# Altium schematic sheet Controller_Section.SchDoc
size A4; DocumentNumber: 4; SheetNumber: 4; SheetTotal: 7
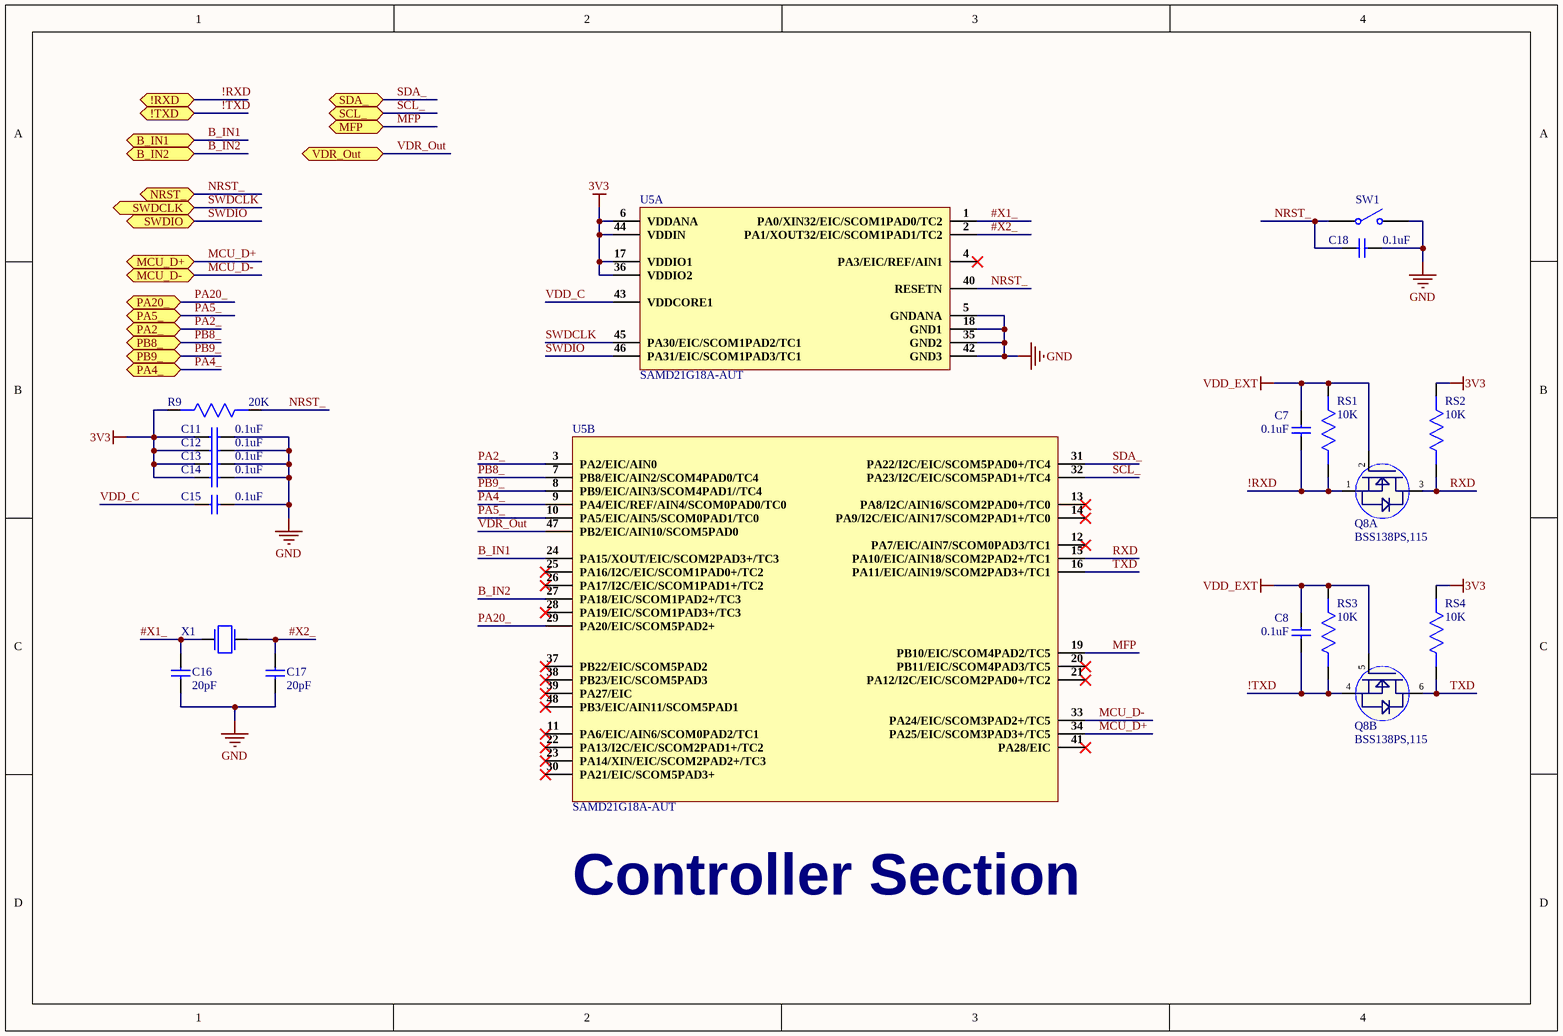
[diagram p0: Controller_Section.SchDoc]

## Parts
C7  0.1uF  [Cap0402]
C8  0.1uF  [Cap0402]
C11  0.1uF  [Cap0402]
C12  0.1uF  [Cap0402]
C13  0.1uF  [Cap0402]
C14  0.1uF  [Cap0402]
C15  0.1uF  [Cap0402]
C16  20pF  [Cap 0201]
C17  20pF  [Cap 0201]
C18  0.1uF  [Cap0402]
Q8  BSS138PS,115  [BSS138PS,115]  (parts A,B of 2)
R9  20K  [Res0402]
RS1  10K  [Res0402]
RS2  10K  [Res0402]
RS3  10K  [Res0402]
RS4  10K  [Res0402]
SW1  B3U-1000P  [B3U-1000P]  (value not drawn)
U5  SAMD21G18A-AUT  [SAMD21G18A-AUT]  (parts A,B of 2)
X1  NX3215SA-32.768K-STD-MUA-8  [2-SMD, No Lead]  (value not drawn)

## Ports
!RXD (bidir), !TXD (bidir), B_IN1 (bidir), B_IN2 (bidir), MCU_D+ (bidir), MCU_D- (bidir), MFP (bidir), NRST_ (bidir), PA2_ (bidir), PA4_ (bidir), PA5_ (bidir), PA20_ (bidir), PB8_ (bidir), PB9_ (bidir), SCL_ (bidir), SDA_ (bidir), SWDCLK (bidir), SWDIO (bidir), VDR_Out (bidir)

## Nets
3V3: C11.1 C12.1 C13.1 C14.1 R9.2 RS2.1 RS4.1 U5.6(VDDANA) U5.17(VDDIO1) U5.36(VDDIO2) U5.44(VDDIN)
GND: C11.2 C12.2 C13.2 C14.2 C15.2 C16.1 C17.1 C18.2 SW1.2 U5.5(GNDANA) U5.18(GND1) U5.35(GND2) U5.42(GND3)
VDD_EXT: C7.2 C8.2 Q8.2(G1) Q8.5(G2) RS1.1 RS3.1
!RXD: C7.1 Q8.1(S1) RS1.2 ; port !RXD
!TXD: C8.1 Q8.4(S2) RS3.2 ; port !TXD
#X1_: C16.2 U5.1(PA0/XIN32/EIC/SCOM1PAD0/TC2) X1.2
#X2_: C17.2 U5.2(PA1/XOUT32/EIC/SCOM1PAD1/TC2) X1.1
B_IN1: U5.24(PA15/XOUT/EIC/SCOM2PAD3+/TC3) ; port B_IN1
B_IN2: U5.27(PA18/EIC/SCOM1PAD2+/TC3) ; port B_IN2
MCU_D+: U5.34(PA25/EIC/SCOM3PAD3+/TC5) ; port MCU_D+
MCU_D-: U5.33(PA24/EIC/SCOM3PAD2+/TC5) ; port MCU_D-
MFP: U5.19(PB10/EIC/SCOM4PAD2/TC5) ; port MFP
NRST_: C18.1 R9.1 SW1.1 U5.40(RESETN) ; port NRST_
PA2_: U5.3(PA2/EIC/AIN0) ; port PA2_
PA4_: U5.9(PA4/EIC/REF/AIN4/SCOM0PAD0/TC0) ; port PA4_
PA5_: U5.10(PA5/EIC/AIN5/SCOM0PAD1/TC0) ; port PA5_
PA20_: U5.29(PA20/EIC/SCOM5PAD2+) ; port PA20_
PB8_: U5.7(PB8/EIC/AIN2/SCOM4PAD0/TC4) ; port PB8_
PB9_: U5.8(PB9/EIC/AIN3/SCOM4PAD1//TC4) ; port PB9_
RXD: Q8.3(D2) RS2.2 U5.15(PA10/EIC/AIN18/SCOM2PAD2+/TC1)
SCL_: U5.32(PA23/I2C/EIC/SCOM5PAD1+/TC4) ; port SCL_
SDA_: U5.31(PA22/I2C/EIC/SCOM5PAD0+/TC4) ; port SDA_
SWDCLK: U5.45(PA30/EIC/SCOM1PAD2/TC1) ; port SWDCLK
SWDIO: U5.46(PA31/EIC/SCOM1PAD3/TC1) ; port SWDIO
TXD: Q8.6(D1) RS4.2 U5.16(PA11/EIC/AIN19/SCOM2PAD3+/TC1)
VDD_C: C15.1 U5.43(VDDCORE1)
VDR_Out: U5.47(PB2/EIC/AIN10/SCOM5PAD0) ; port VDR_Out

Not connected (* = marked no-connect by the designer): U5 4(PA3/EIC/REF/AIN1)* 11(PA6/EIC/AIN6/SCOM0PAD2/TC1)* 12(PA7/EIC/AIN7/SCOM0PAD3/TC1)* 13(PA8/I2C/AIN16/SCOM2PAD0+/TC0)* 14(PA9/I2C/EIC/AIN17/SCOM2PAD1+/TC0)* 20(PB11/EIC/SCOM4PAD3/TC5)* 21(PA12/I2C/EIC/SCOM2PAD0+/TC2)* 22(PA13/I2C/EIC/SCOM2PAD1+/TC2)* 23(PA14/XIN/EIC/SCOM2PAD2+/TC3)* 25(PA16/I2C/EIC/SCOM1PAD0+/TC2)* 26(PA17/I2C/EIC/SCOM1PAD1+/TC2)* 28(PA19/EIC/SCOM1PAD3+/TC3)* 30(PA21/EIC/SCOM5PAD3+)* 37(PB22/EIC/SCOM5PAD2)* 38(PB23/EIC/SCOM5PAD3)* 39(PA27/EIC)* 41(PA28/EIC)* 48(PB3/EIC/AIN11/SCOM5PAD1)*

## Notes on the sheet
- Controller Section

## Library data of the parts
C7 C8 C11-C15 C18 = CC0402KRX7R7BB104: CAP CER 0.1UF 16V X7R 0402; Manufacturer: Yageo; Tolerance: 10%; Capacitance: 100nF; Supplier 1: Digi-Key; Manufacturer Part Number: CC0402KRX7R7BB104; Stock 1: 16982736; Pricing 1: 1=0.1, 10=0.034, 100=0.015, 500=0.0107, 1000=0.00841, 2500=0.00764, 5000=0.00703 (USD); Mount: Surface Mount; Case/Package: 0402; Number of Pins: 2; Case Code (Metric): 1005; Case Code (Imperial): 0402; Min Operating Temperature: -55°C; Max Operating Temperature: 125°C; Dielectric: X7R; Voltage Rating: 16V; Voltage Rating (DC): 16V; Packaging: Tape and Reel; Package Quantity: 1; Termination: SMD/SMT; Composition: Ceramic; Voltage: 16V; Length: 1mm; Height: 0.5mm; Width: 0.02inch; Thickness: 0.022inch; Depth: 0.5mm; Radiation Hardening: No; REACH SVHC: No SVHC; Lead Free: Lead Free; Halogen Free: Halogen Free; ComponentLink1URL: http://www.yageo.com/documents/recent/UPY-GPHC_X7R_6.3V-to-50V_8.pdf?src-supplier=Avnet+Europe; ComponentLink1Description: http://www.yageo.com/documents/recent/UPY-GPHC_X7R_6.3V-to-50V_8.pdf?src-supplier=Avnet+Europe; ComponentLink2URL: http://www.yageo.com/documents/recent/UPY-GPHC_X7R_6.3V-to-50V_18.pdf?src-supplier=Digi-Key; ComponentLink2Description: http://www.yageo.com/documents/recent/UPY-GPHC_X7R_6.3V-to-50V_18.pdf?src-supplier=Digi-Key; ComponentLink3URL: http://www.yageo.com/documents/recent/UPY-GPHC_X7R_6.3V-to-50V_8.pdf?src-supplier=Avnet; ComponentLink3Description: http://www.yageo.com/documents/recent/UPY-GPHC_X7R_6.3V-to-50V_8.pdf?src-supplier=Avnet; ComponentLink4URL: http://www.yageo.com/documents/recent/UPY-GPHC_X7R_6.3V-to-50V_18.pdf?src-supplier=Mouser; ComponentLink4Description: http://www.yageo.com/documents/recent/UPY-GPHC_X7R_6.3V-to-50V_18.pdf?src-supplier=Mouser; ComponentLink5URL: http://www.farnell.com/datasheets/2167236.pdf?src-supplier=Element14; ComponentLink5Description: http://www.farnell.com/datasheets/2167236.pdf?src-supplier=Element14; ComponentLink6URL: http://www.farnell.com/datasheets/1489800.pdf?src-supplier=Element14; ComponentLink6Description: http://www.farnell.com/datasheets/1489800.pdf?src-supplier=Element14; Supplier Part Number 1: 311-1338-1-ND
C16 C17 = GJM0336C1E200JB01D: CAP CER 20PF 25V C0H 0201; Manufacturer: Murata; Tolerance: 5%; Supplier 1: Digi-Key; Manufacturer Part Number: GJM0336C1E200JB01D; Stock 1: 13650; Pricing 1: 1=0.1, 10=0.074, 100=0.0329, 500=0.02348, 1000=0.01845, 2500=0.01678, 5000=0.01543 (USD); Mount: Surface Mount; Case/Package: 0201; Case Code (Metric): 0603; Case Code (Imperial): 0201; Min Operating Temperature: -55°C; Max Operating Temperature: 125°C; Capacitance: 20pF; Voltage Rating: 25V; Packaging: Tape and Reel; Termination: SMD/SMT; Voltage Rating (DC): 25V; Length: 0.024inch; Width: 0.012inch; Thickness: 0.013inch; Lead Free: Lead Free; ComponentLink1URL: http://www.mouser.com/ds/2/281/c02e-2905.pdf?src-supplier=Mouser; ComponentLink1Description: http://www.mouser.com/ds/2/281/c02e-2905.pdf?src-supplier=Mouser; ComponentLink2URL: http://search.murata.co.jp/Ceramy/image/img/A01X/partnumbering_e_01.pdf?src-supplier=Digi-Key; ComponentLink2Description: http://search.murata.co.jp/Ceramy/image/img/A01X/partnumbering_e_01.pdf?src-supplier=Digi-Key; Supplier Part Number 1: 490-13313-1-ND
Q8 = BSS138PS,115: MOSFET 2N-CH 60V 0.32A 6TSSOP; Manufacturer: Nexperia; Supplier 1: Digi-Key; Manufacturer Part Number: BSS138PS,115; Stock 1: 143402; Pricing 1: 1=0.42, 10=0.31, 25=0.2716, 100=0.1474, 250=0.14668, 500=0.12028, 1000=0.08924 (USD); ComponentLink1URL: http://www.farnell.com/datasheets/1443348.pdf?src-supplier=Farnell; ComponentLink1Description: http://www.farnell.com/datasheets/1443348.pdf?src-supplier=Farnell; ComponentLink2URL: https://assets.nexperia.com/documents/data-sheet/BSS138PS.pdf?src-supplier=Digi-Key; ComponentLink2Description: https://assets.nexperia.com/documents/data-sheet/BSS138PS.pdf?src-supplier=Digi-Key; ComponentLink3URL: http://www.farnell.com/datasheets/1443348.pdf?src-supplier=Newark; ComponentLink3Description: http://www.farnell.com/datasheets/1443348.pdf?src-supplier=Newark; Supplier Part Number 1: 1727-6479-1-ND
R9 = RC0402JR-0720KL: RES SMD 20K OHM 5% 1/16W 0402; Manufacturer: Yageo; Resistance: 20kR; Power Rating: 62.5mW; Voltage Rating: 50V; Temperature Coefficient: 100ppm/°C; Max Power Dissipation: 63mW; Supplier 1: Digi-Key; Manufacturer Part Number: RC0402JR-0720KL; Stock 1: 4817510; Pricing 1: 1=0.1, 10=0.013, 100=0.0053, 1000=0.00236, 2500=0.00205, 5000=0.00169 (USD); Case/Package: 0402; Number of Pins: 2; Case Code (Metric): 1005; Case Code (Imperial): 0402; Min Operating Temperature: -55°C; Max Operating Temperature: 155°C; Package Quantity: 1; Tolerance: 5%; Packaging: Tape and Reel; Composition: Thick Film; Number of Terminations: 2; Termination: SMD/SMT; Military Standard: Not; Voltage Rating (DC): 50V; Features: Moisture Resistant; Length: 0.039inch; Height: 0.016inch; Width: 0.02inch; Depth: 0.5mm; REACH SVHC: No SVHC; Lead Free: Lead Free; ComponentLink1URL: http://www.yageo.com/documents/recent/PYu-RC_Group_51_RoHS_L_9.pdf?src-supplier=Digi-Key; ComponentLink1Description: http://www.yageo.com/documents/recent/PYu-RC_Group_51_RoHS_L_9.pdf?src-supplier=Digi-Key; ComponentLink2URL: http://www.farnell.com/datasheets/1018594.pdf?src-supplier=Element14; ComponentLink2Description: http://www.farnell.com/datasheets/1018594.pdf?src-supplier=Element14; ComponentLink3URL: http://www.mouser.com/ds/2/447/PYu-RC0402_51_RoHS_L_6_r-8721.pdf?src-supplier=Mouser; ComponentLink3Description: http://www.mouser.com/ds/2/447/PYu-RC0402_51_RoHS_L_6_r-8721.pdf?src-supplier=Mouser; ComponentLink4URL: http://www.yageo.com/documents/recent/PYu-RC0402_51_RoHS_L_6_r.pdf?src-supplier=Future+Electronics; ComponentLink4Description: http://www.yageo.com/documents/recent/PYu-RC0402_51_RoHS_L_6_r.pdf?src-supplier=Future+Electronics; Supplier Part Number 1: 311-20KJRCT-ND
RS1-RS4 = RK73B1ETTP103J: RES 10K OHM 5% 1/10W 0402; Manufacturer: KOA Speer; Resistance: 10kR; Power Rating: 63mW; Voltage Rating: 50V; Temperature Coefficient: 200ppm/°C; Supplier 1: Digi-Key; Manufacturer Part Number: RK73B1ETTP103J; Stock 1: 2917894; Pricing 1: 1=0.1, 10=0.016, 100=0.0065, 1000=0.00292, 2500=0.00253, 5000=0.00209 (USD); Mount: Surface Mount; Case/Package: 0402; Case Code (Imperial): 0402; Case Code (Metric): 1005; Min Operating Temperature: -55°C; Max Operating Temperature: 155°C; Packaging: Tape and Reel; Tolerance: 5%; Package Quantity: 10000; Composition: Thick Film; Termination: SMD/SMT; Military Standard: Not; Voltage Rating (DC): 50V; Length: 1mm; Height: 0.35mm; Width: 0.5mm; Depth: 0.5mm; Lead Free: Lead Free; ComponentLink1URL: https://www.verical.com/server-webapp/html/getDatasheet?partID=89073&src-supplier=Verical; ComponentLink1Description: https://www.verical.com/server-webapp/html/getDatasheet?partID=89073&src-supplier=Verical; Supplier Part Number 1: 2019-RK73B1ETTP103JCT-ND
SW1 = B3U-1000P: SWITCH TACTILE SPST-NO 0.05A 12V; Manufacturer: Omron; Mechanical Life: 200000Cycles; Operating Force: 1.5N; Throw Configuration: SPST; Current Rating: 50mA; Contact Resistance: 100mR; Illumination Type: Non-Illuminated,Illuminated; Switch Travel: 0.15mm; Switch Function: Off-Mom; Actuator Type: Standard; Actuator Length: 0.4mm; Ratings: Dust Proof,IP40; ComponentLink1URL: http://www.farnell.com/datasheets/60838.pdf?src-supplier=Farnell; ComponentLink1Description: http://www.farnell.com/datasheets/60838.pdf?src-supplier=Farnell; ComponentLink2URL: http://www.farnell.com/datasheets/60838.pdf?src-supplier=Element14; ComponentLink2Description: http://www.farnell.com/datasheets/60838.pdf?src-supplier=Element14; ComponentLink3URL: https://omronfs.omron.com/en_US/ecb/products/pdf/en-b3u.pdf?src-supplier=Digi-Key; ComponentLink3Description: https://omronfs.omron.com/en_US/ecb/products/pdf/en-b3u.pdf?src-supplier=Digi-Key; ComponentLink4URL: http://www.omron.com/ecb/products/pdf/en-b3u.pdf?src-supplier=Digi-Key; ComponentLink4Description: http://www.omron.com/ecb/products/pdf/en-b3u.pdf?src-supplier=Digi-Key; ComponentLink5URL: https://www.distrelec.biz/Web/Downloads/he/et/B3U_eng_datasheet.pdf?mime=application%2Fpdf&src-supplier=Distrelec; ComponentLink5Description: https://www.distrelec.biz/Web/Downloads/he/et/B3U_eng_datasheet.pdf?mime=application%2Fpdf&src-supplier=Distrelec; ComponentLink6URL: http://www.onlinecomponents.com/productFiles/mf-OM/en-b3u.pdf?src-supplier=Onlinecomponents.com; ComponentLink6Description: http://www.onlinecomponents.com/productFiles/mf-OM/en-b3u.pdf?src-supplier=Onlinecomponents.com; Supplier 1: Digi-Key; Manufacturer Part Number: B3U-1000P; Stock 1: 116454; Pricing 1: 1=1, 10=0.961, 25=0.9064, 50=0.7976, 100=0.7251, 250=0.68888, 500=0.67074, 1000=0.52571 (USD); Mount: Surface Mount; Weight: 0.000776oz; Contact Material: Silver; Min Operating Temperature: -25°C; Max Operating Temperature: 70°C; Packaging: Tape and Reel; Voltage Rating (DC): 12V; Package Quantity: 1; Max Current Rating: 50mA; Termination: SMD/SMT; Orientation: Straight; Max Voltage Rating (DC): 12V; Electrical Life: 200000Cycles; Insulation Resistance: 100MR; Contact Current Rating: 50mA; Length: 4mm; Height: 1.2mm; Depth: 2.5mm; Width: 3mm; REACH SVHC: Unknown; Lead Free: Lead Free; ComponentLink7URL: https://www.verical.com/server-webapp/html/getDatasheet?partID=552554&src-supplier=Verical; ComponentLink7Description: https://www.verical.com/server-webapp/html/getDatasheet?partID=552554&src-supplier=Verical; ComponentLink8URL: http://www.farnell.com/datasheets/1685550.pdf?src-supplier=Element14; ComponentLink8Description: http://www.farnell.com/datasheets/1685550.pdf?src-supplier=Element14; ComponentLink9URL: http://www.farnell.com/datasheets/2610940.pdf?src-supplier=Farnell; ComponentLink9Description: http://www.farnell.com/datasheets/2610940.pdf?src-supplier=Farnell; ComponentLink10URL: https://www.alliedelec.com/m/d/4c8a9ef82804fc3c241a13c1e298fd73.pdf?src-supplier=Allied+Electronics; ComponentLink10Description: https://www.alliedelec.com/m/d/4c8a9ef82804fc3c241a13c1e298fd73.pdf?src-supplier=Allied+Electronics; Supplier Part Number 1: SW1020DKR-ND
U5 = SAMD21G18A-AUT: IC MCU 32BIT 256KB FLASH 48TQFP; Manufacturer: Microchip; Manufacturer Part Number: ATSAMD21G18A-AUT; Supplier 1: Digi-Key; Stock 1: 4547; Pricing 1: 1=3.32, 25=3.0104, 100=2.7348 (USD); ComponentLink1URL: http://www.microchip.com/mymicrochip/filehandler.aspx?ddocname=en590210; ComponentLink1Description: http://www.microchip.com/mymicrochip/filehandler.aspx?ddocname=en590210; Supplier Part Number 1: ATSAMD21G18A-AUTDKR-ND
X1 = NX3215SA-32.768K-STD-MUA-8: CRYSTAL 32.7680KHZ 12.5PF SMD; Manufacturer: NDK; Frequency: 32.768kHz; Frequency Tolerance: 20ppm; ESR (Equivalent Series Resistance): 70kR; Supplier 1: Digi-Key; Manufacturer Part Number: NX3215SA-32.768K-STD-MUA-8; Stock 1: 29951; Pricing 1: 1=0.68, 10=0.602, 50=0.5628, 100=0.4974, 500=0.47124, 1000=0.3927 (USD); Mount: Surface Mount; Case/Package: SMD/SMT; Number of Pins: 2; Min Operating Temperature: -40°C; Max Operating Temperature: 85°C; Package Quantity: 1000; Load Capacitance: 12.5pF; Packaging: Tape and Reel; Length: 0.126inch; Height: 0.035inch; Width: 0.059inch; Lead Free: Lead Free; ComponentLink1URL: https://media.digikey.com/pdf/Data%20Sheets/NDK%20PDFs/NX3215SA-32.768K-STD-MUA-8.pdf?src-supplier=Digi-Key; ComponentLink1Description: https://media.digikey.com/pdf/Data%20Sheets/NDK%20PDFs/NX3215SA-32.768K-STD-MUA-8.pdf?src-supplier=Digi-Key; ComponentLink2URL: http://www.ndk.com/images/products/catalog/c_NX3215SA-STD-MUA-14_e.pdf?src-supplier=Digi-Key; ComponentLink2Description: http://www.ndk.com/images/products/catalog/c_NX3215SA-STD-MUA-14_e.pdf?src-supplier=Digi-Key; Supplier Part Number 1: 644-1156-6-ND